# Altium schematic sheet Switch.SchDoc
size 406 x 304 mm; SheetNumber: 8; SheetTotal: 8
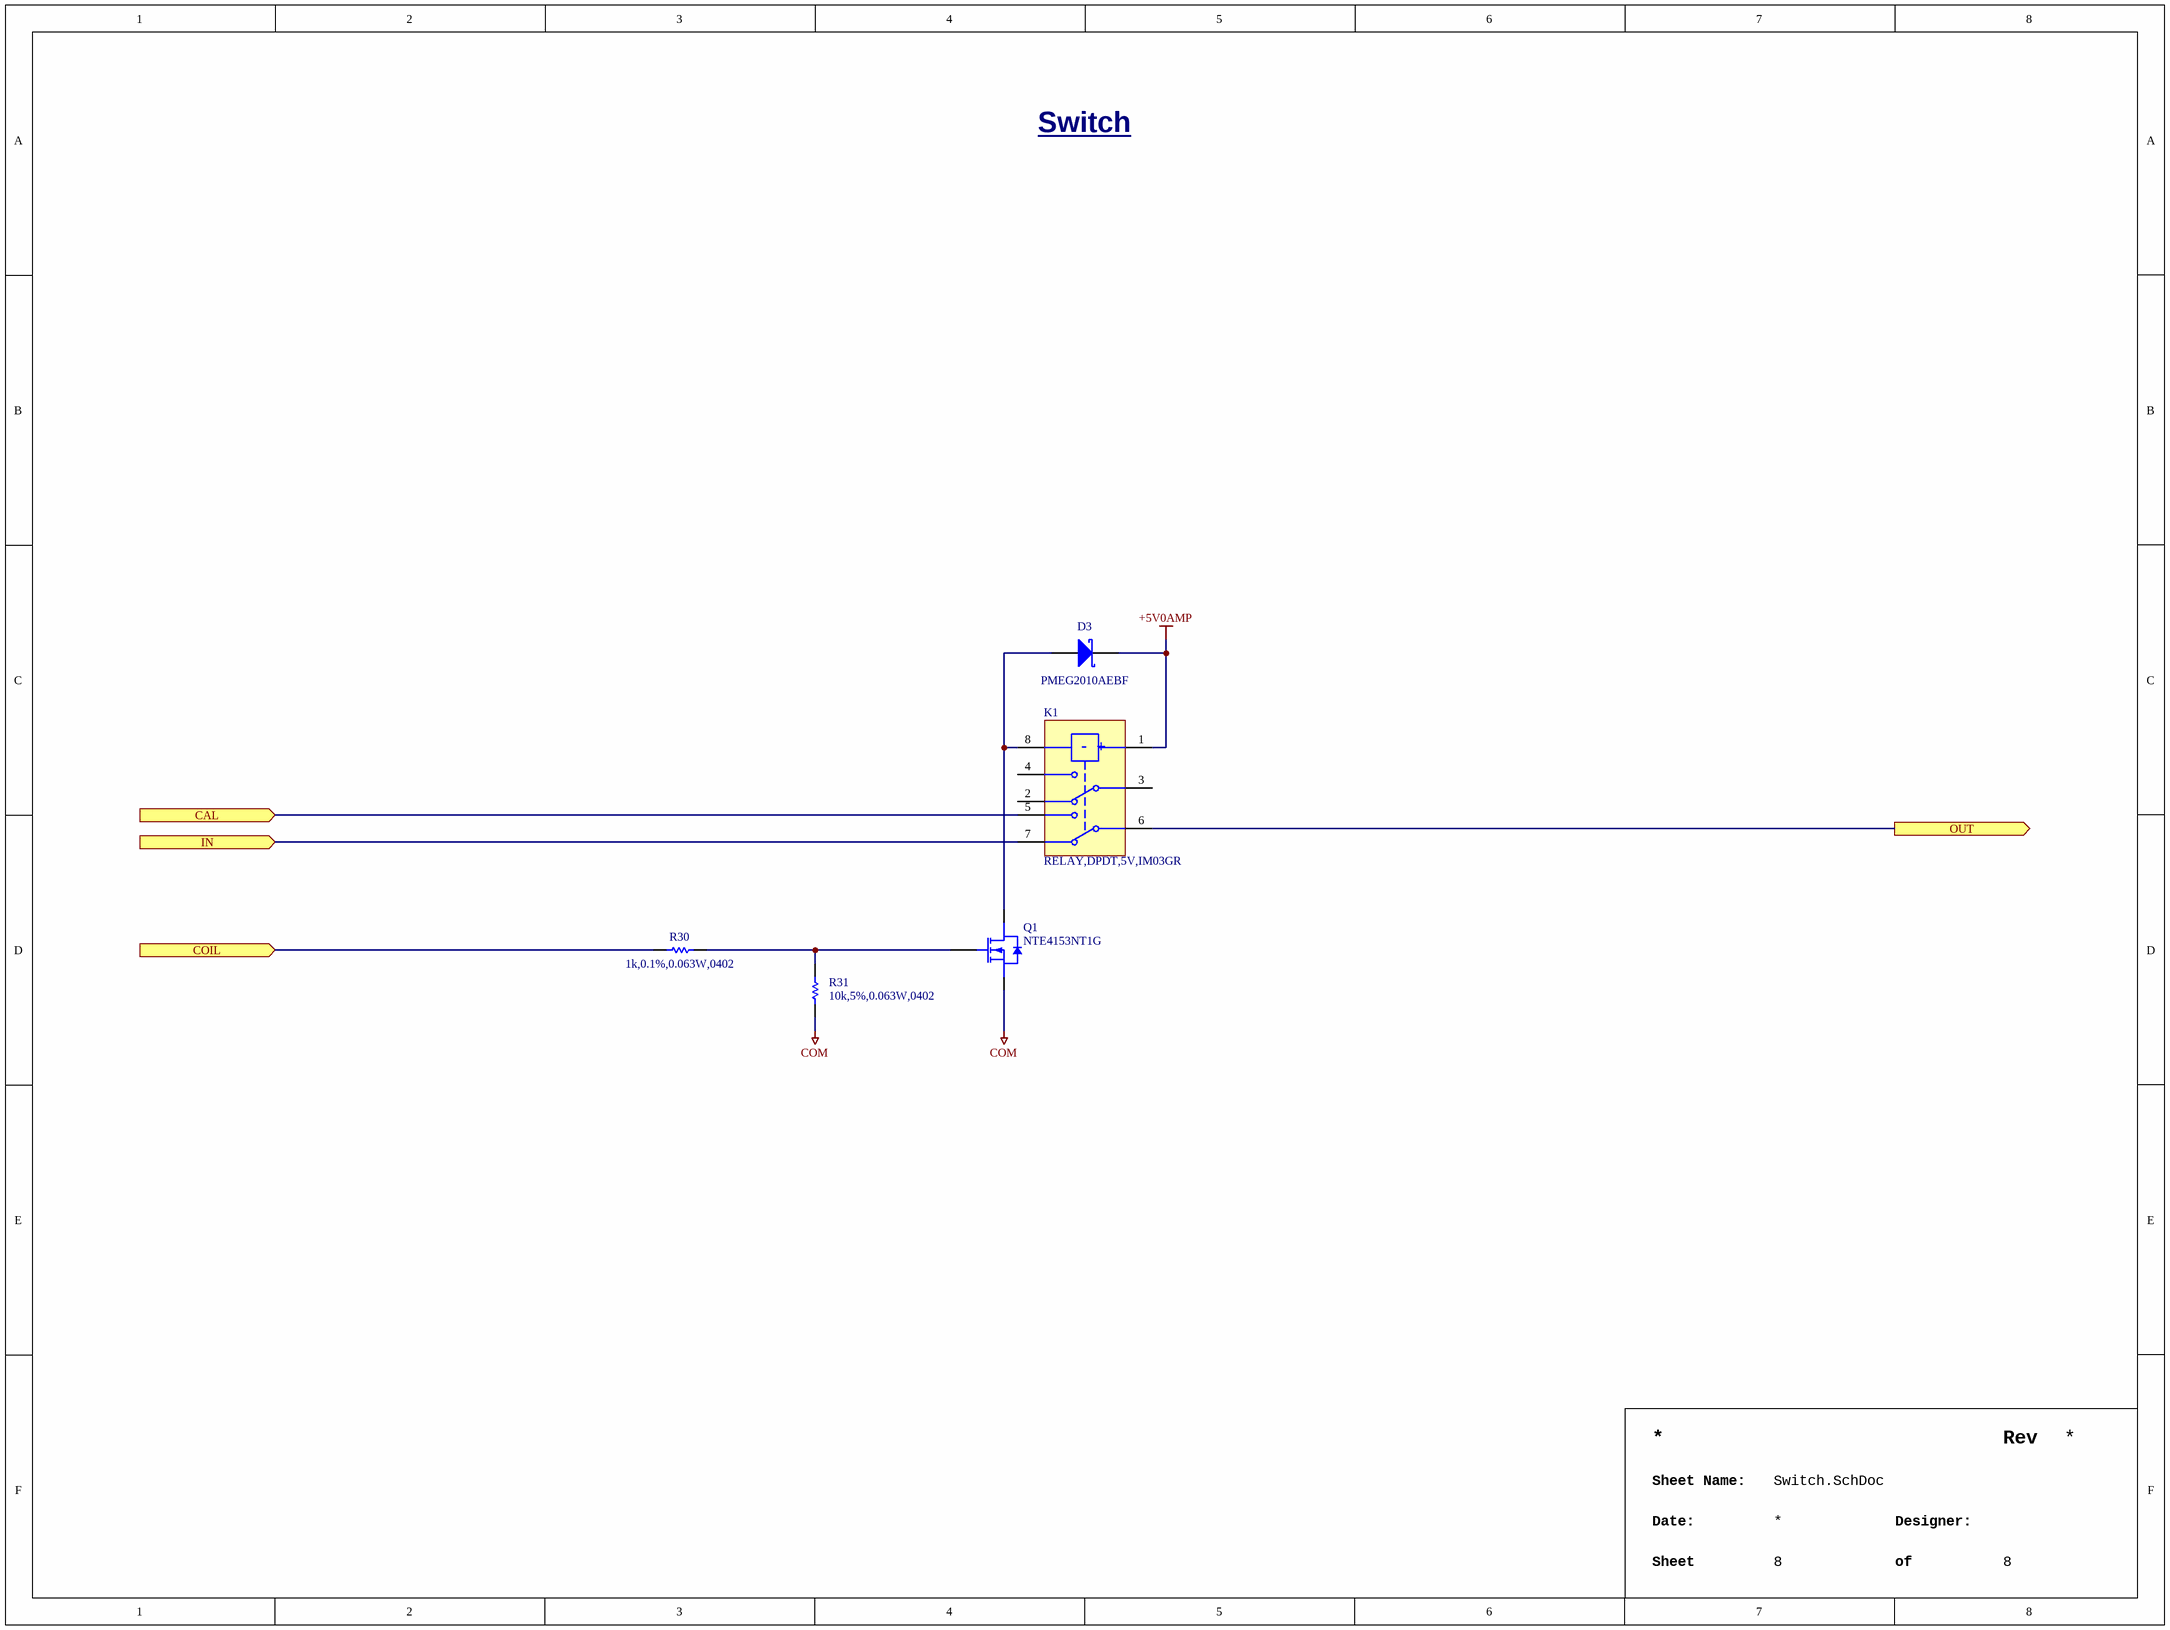
[diagram p0: Switch.SchDoc]

## Parts
D3  PMEG2010AEBF  [NEXPERIA_PKG_SOD523]
K1  RELAY,DPDT,5V,IM03GR  [TE_PKG_IM_GULLWING]
Q1  NTE4153NT1G  [ONSEMI_SC-89]
R30  1k,0.1%,0.063W,0402  [RESC1005X04N]
R31  10k,5%,0.063W,0402  [RESC1005X04N]

## Ports
CAL (in), COIL (in), IN (in), OUT (out)

## Nets
+5V0AMP: D3.1(K) K1.1(COILP)
COM: Q1.2(S) R31.2
CAL: K1.5(NO) ; port CAL
COIL: R30.1 ; port COIL
IN: K1.7(NC) ; port IN
OUT: K1.6(C) ; port OUT
NetD3_2: D3.2(A) K1.8(COILN) Q1.3(D)
NetQ1_1: Q1.1(G) R30.2 R31.1

Not connected (* = marked no-connect by the designer): K1 2(NC) 3(C) 4(NO)

## Notes on the sheet
- Switch
- Rev
- Sheet Name:
- Date:
- Sheet
- Designer:
- of
- (in symbol RELAY,DPDT,5V,IM03GR) -; +

## Library data of the parts
D3 = DIODE,Schottky,20V,1A,SOD523: Diode 20 V 1A Surface Mount SOD-523; Manufacturer 1: Nexperia USA Inc.; Vendor 1 Part Number: 1727-8539-1-ND; Vendor 1: DigiKey; Part Name: DIODE,Schottky,20V,1A,SOD523; CreatedBy: Judd Foster; HelpURL: https://assets.nexperia.com/documents/data-sheet/PMEG2010AEB.pdf; Manufacturer 1 Part Number: PMEG2010AEBF
K1 = RELAY,DPDT,5V,IM03GR: Manufacturer 1: TE Connectivity; Part Name: RELAY,DPDT,5V,IM03GR; CreatedBy: Kevin Heyer; HelpURL: https://www.te.com/commerce/DocumentDelivery/DDEController?Action=srchrtrv&DocNm=1-1773734-7_IM_Relay_I_Type&DocType=DS&DocLang=English; Manufacturer 1 Part Number: IM03GR
Q1 = MOSFET,N Ch,20V,915mA: N-Channel 20 V 915mA (Ta) 300mW (Tj) Surface Mount SC-89-3; Manufacturer 1: onsemi; Vendor 1 Part Number: NTE4153NT1GOSCT-ND; Vendor 1: Digikey; Part Name: MOSFET,N Ch,20V,915mA; CreatedBy: Judd Foster; HelpURL: https://www.onsemi.com/pdf/datasheet/nta4153n-d.pdf; Manufacturer 1 Part Number: NTE4153NT1G
R30 = RES,1k,0.1%,0.063W,0402: 1 kOhms Â±0.1% 0.063W, 1/16W Chip Resistor 0402 (1005 Metric) Thin Film; Manufacturer 1: YAGEO; Manufacturer 1 Part Number: RT0402BRE071KL; Vendor 1 Part Number: YAG2306CT-ND; Vendor 1: DigiKey; Part Name: RES,1k,0.1%,0.063W,0402; CreatedBy: Judd Foster; HelpURL: https://www.yageo.com/upload/media/product/app/datasheet/rchip/pyu-rt_1-to-0.01_rohs_l.pdf; Value: 1k
R31 = RES,10k,5%,0.063W,0402: 10 kOhms ï¿½5% 0.063W, 1/16W Chip Resistor 0402 (1005 Metric) Automotive AEC-Q200 Thick Film; Manufacturer 1: Stackpole Electronics Inc; Manufacturer 1 Part Number: RMCF0402JT10K0; Vendor 1 Part Number: RMCF0402JT10K0CT-ND; Vendor 1: DIgikey; Part Name: RES,10k,5%,0.063W,0402; CreatedBy: Judd Foster; HelpURL: https://www.seielect.com/catalog/sei-rmcf_rmcp.pdf; Value: 10k